# Altium schematic sheet zulu_a7_1.SchDoc
size 236 x 314 mm; Author: Christian Tambe; VERSION#: 1.0; Origin: Eagle; OriginPath: C:\Users\tambe\Documents\Electronics\Zulu_A7\Zulu_Altrium\zulu_a7.sch; OriginSheet: 2; OriginDescription: Power Supplies
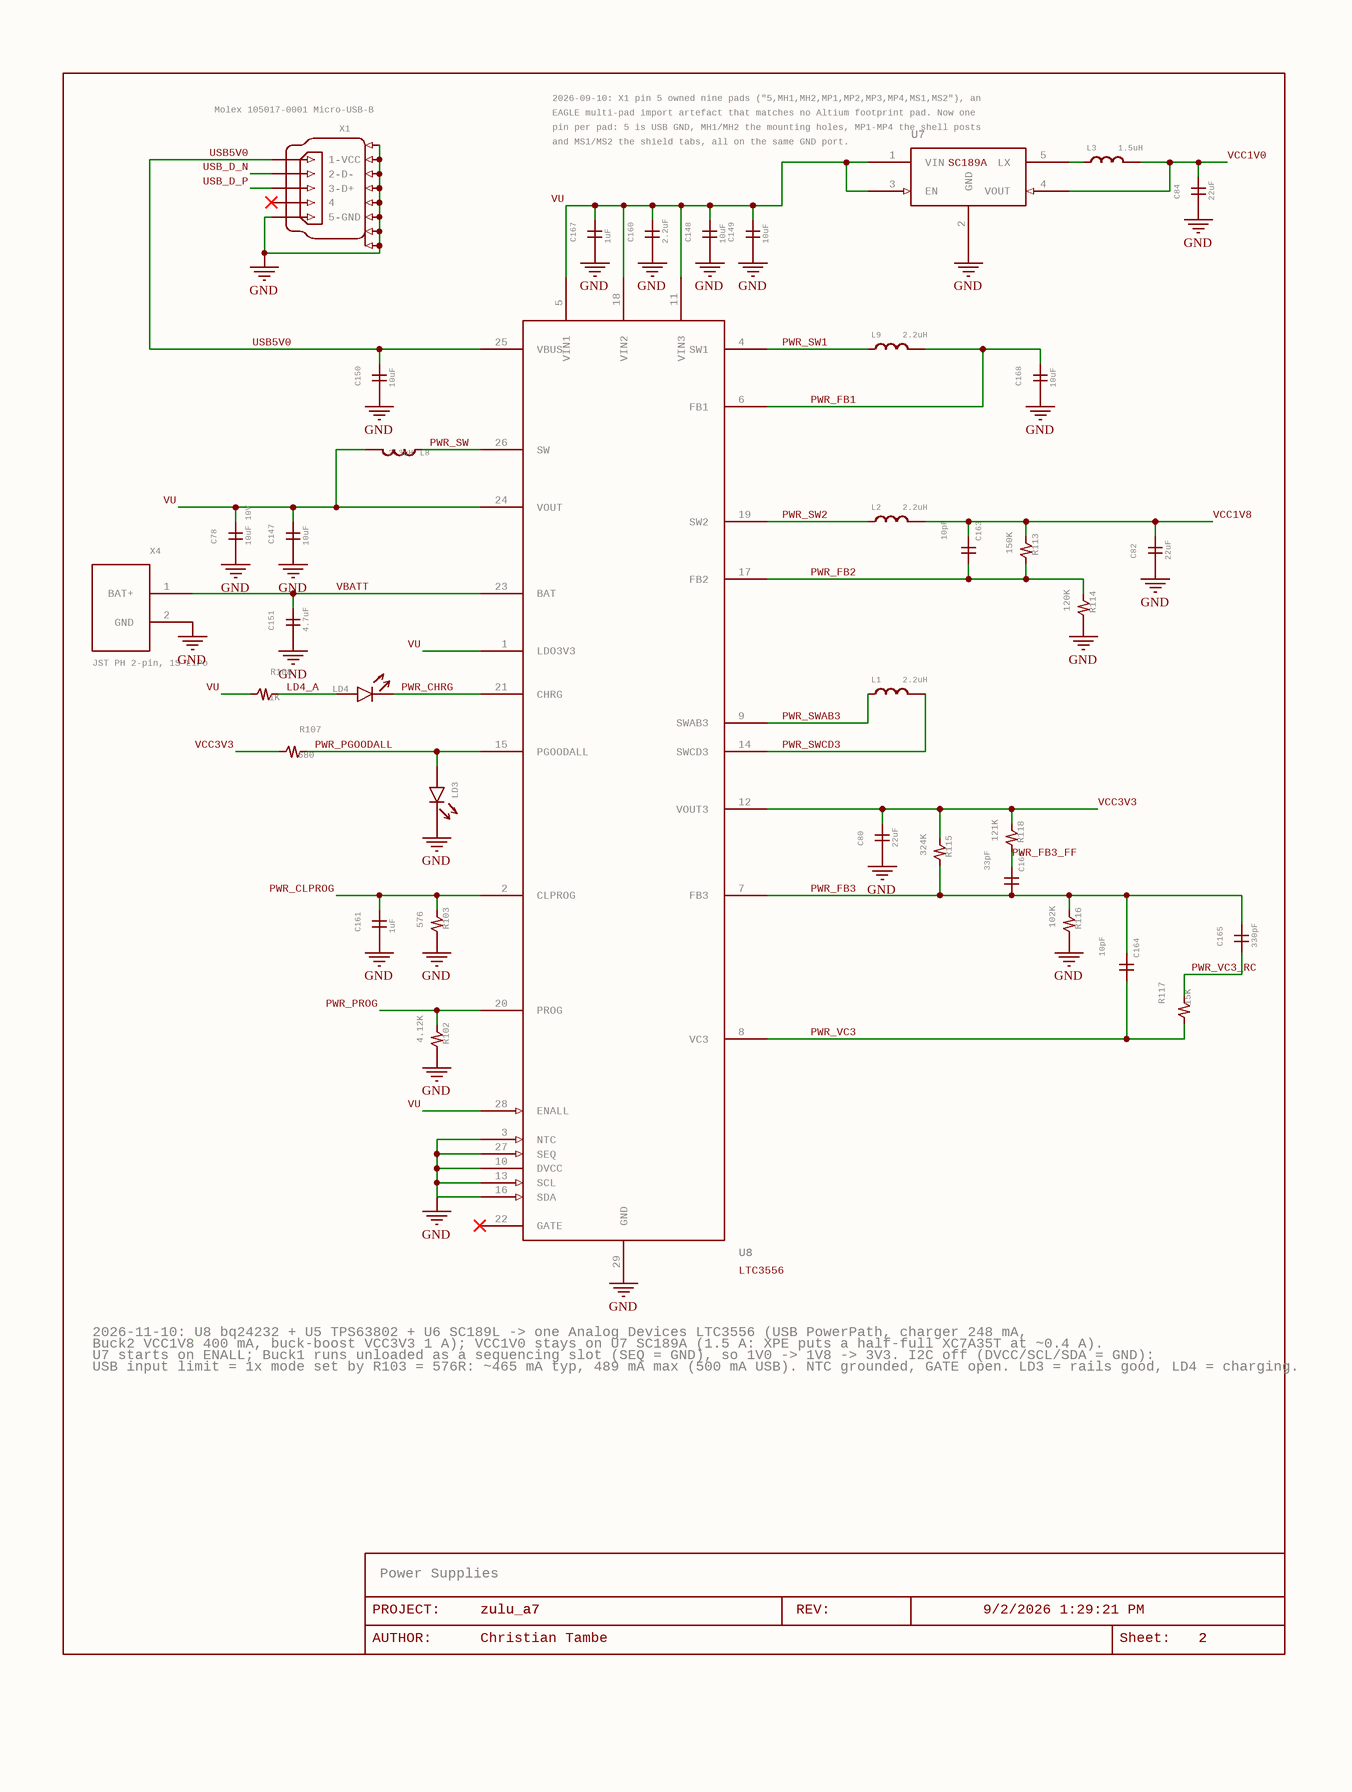
[diagram p0: zulu_a7_1.SchDoc]

## Parts
C78  10uF 10V  [C0805]
C80  22uF  [C0805]
C82  22uF  [C0603]
C84  22uF  [C0603]
C147  10uF  [C0603]
C148  10uF  [C0603]
C149  10uF  [C0805]
C150  10uF  [C0603]
C151  4.7uF  [C0603]
C160  2.2uF  [C0402]
C161  1uF  [C0402]
C163  10pF  [C0201]
C164  10pF  [C0201]
C165  330pF  [C0201]
C166  33pF  [C0201]
C167  1uF  [C0402]
C168  10uF  [C0603]
FRAME5  LAST_DATE_TIME: 9/2/2026 1:29:21 PM  Sheet: Sheet:  SHEET: 2  REV: REV:  PROJECT: PROJECT:  DRAWING_NAME: zulu_a7  AUTHOR: Christian Tambe  (hidden comment: DOCFIELD)  (graphical)
L1  2.2uH  [IND2520]
L2  2.2uH  [IND2520]
L3  1.5uH  [IND2520]
L8  3.3uH  [IND2520]
L9  2.2uH  [IND2520]
LD3  red  [LED0603]  (value not drawn)
LD4  red  [LED0603]  (value not drawn)
R102  4.12K  [R0402]
R103  576  [R0402]
R107  680  [R0402]
R108  1K  [R0402]
R113  150K  [R0201]
R114  120K  [R0201]
R115  324K  [R0201]
R116  102K  [R0201]
R117  15K  [R0201]
R118  121K  [R0201]
U7  PartName: SC189A  [SOT23-5]  (hidden comment: SC189ASKTRT)
U8  PartName: LTC3556  [QFN28-UFD-4X5]  (hidden comment: LTC3556EUFD#PBF)
X1  Molex 105017-0001 Micro-USB-B  [MOLEX-105017-0001]
X4  JST PH 2-pin, 1S LiPo  [JST-S2B-PH-SM4-TB]

## Nets
GND: C78.1 C80.1 C82.1 C84.1 C147.1 C148.1 C149.1 C150.1 C151.1 C160.1 C161.1 C167.1 C168.1 LD3.K R102.2 R103.2 R114.2 R116.2 U7.2(GND) U8.3(NTC) U8.10(DVCC) U8.13(SCL) U8.16(SDA) U8.27(SEQ) U8.29(GND) X1.5(5-GND) X1.MH1(GND) X1.MH2(GND) X1.MP1(GND) X1.MP2(GND) X1.MP3(GND) X1.MP4(GND) X1.MS1(GND) X1.MS2(GND) X4.2(GND)
LD4_A: LD4.A R108.2
PWR_CHRG: LD4.K U8.21(CHRG)
PWR_CLPROG: C161.2 R103.1 U8.2(CLPROG)
PWR_FB1: C168.2 L9.2 U8.6(FB1)
PWR_FB2: C163.2 R113.2 R114.1 U8.17(FB2)
PWR_FB3: C164.1 C165.2 C166.2 R115.2 R116.1 U8.7(FB3)
PWR_FB3_FF: C166.1 R118.2
PWR_PGOODALL: LD3.A R107.2 U8.15(PGOODALL)
PWR_PROG: R102.1 U8.20(PROG)
PWR_SW: L8.1 U8.26(SW)
PWR_SW1: L9.1 U8.4(SW1)
PWR_SW2: L2.1 U8.19(SW2)
PWR_SWAB3: L1.1 U8.9(SWAB3)
PWR_SWCD3: L1.2 U8.14(SWCD3)
PWR_VC3: C164.2 R117.1 U8.8(VC3)
PWR_VC3_RC: C165.1 R117.2
USB5V0: C150.2 U8.25(VBUS) X1.1(1-VCC)
USB_D_N: X1.2(2-D-)
USB_D_P: X1.3(3-D+)
VBATT: C151.2 U8.23(BAT) X4.1(BAT+)
VCC1V0: C84.2 L3.2 U7.4(VOUT)
VCC1V8: C82.2 C163.1 L2.2 R113.1
VCC3V3: C80.2 R107.1 R115.1 R118.1 U8.12(VOUT3)
VU: C78.2 C147.2 C148.2 C149.2 C160.2 C167.2 L8.2 R108.1 U7.1(VIN) U7.3(EN) U8.1(LDO3V3) U8.5(VIN1) U8.11(VIN3) U8.18(VIN2) U8.24(VOUT) U8.28(ENALL)
NetL3_1: L3.1 U7.5(LX)

Not connected (* = marked no-connect by the designer): U8 22(GATE)*; X1 4*

## Notes on the sheet
- 2026-09-10: X1 pin 5 owned nine pads ("5,MH1,MH2,MP1,MP2,MP3,MP4,MS1,MS2"), an
- (near U7) EAGLE multi-pad import artefact that matches no Altium footprint pad. Now one
- (near U7) pin per pad: 5 is USB GND, MH1/MH2 the mounting holes, MP1-MP4 the shell posts
- and MS1/MS2 the shield tabs, all on the same GND port.
- 2026-11-10: U8 bq24232 + U5 TPS63802 + U6 SC189L -> one Analog Devices LTC3556 (USB PowerPath, charger 248 mA,
- Buck2 VCC1V8 400 mA, buck-boost VCC3V3 1 A); VCC1V0 stays on U7 SC189A (1.5 A: XPE puts a half-full XC7A35T at ~0.4 A).
- U7 starts on ENALL; Buck1 runs unloaded as a sequencing slot (SEQ = GND), so 1V0 -> 1V8 -> 3V3. I2C off (DVCC/SCL/SDA = GND):
- USB input limit = 1x mode set by R103 = 576R: ~465 mA typ, 489 mA max (500 mA USB). NTC grounded, GATE open. LD3 = rails good, LD4 = charging.
- (near FRAME5) Power Supplies
- (near FRAME5) AUTHOR:

## Library data of the parts
C78 = C-GENERICC0603: CAPACITOR, generic non-polarized, horizontal pins; GateName_1: G$1; SymbolName_1: C-GENERIC-H; MANF: Samsung; MANF#: CL21A106KPFNNNG; SPEC: X5R 10V +-10% 0805 10uF -- VU bulk; DeviceName: C0805; LibraryName: rcl; DeviceSetName: C-GENERIC
C80 = C-GENERICC0603: CAPACITOR, generic non-polarized, horizontal pins; GateName_1: G$1; SymbolName_1: C-GENERIC-H; MANF: Murata; MANF#: GRM21BR61A226ME44L; SPEC: X5R 10V +-20% 0805 22uF -- buck-boost (VCC3V3) output capacitor, the 22 uF the Type III values assume; DeviceName: C0805; LibraryName: rcl; DeviceSetName: C-GENERIC
C82 = C-GENERICC0603: CAPACITOR, generic non-polarized, horizontal pins; GateName_1: G$1; SymbolName_1: C-GENERIC-H; MANF: Samsung; MANF#: CL10A226MP8NUNE; SPEC: X5R 10V +-20% 0603 22uF -- Buck2 (VCC1V8) output capacitor; DeviceName: C0603; LibraryName: rcl; DeviceSetName: C-GENERIC
C84 = C-GENERICC0603: CAPACITOR, generic non-polarized, horizontal pins; GateName_1: G$1; SymbolName_1: C-GENERIC-H; MANF: Samsung; MANF#: CL10A226MP8NUNE; SPEC: X5R 10V +-20% 0603 22uF -- U7 SC189A (VCC1V0) output capacitor; DeviceName: C0603; LibraryName: rcl; DeviceSetName: C-GENERIC
C147 = C-GENERICC0603: CAPACITOR, generic non-polarized, horizontal pins; GateName_1: G$1; SymbolName_1: C-GENERIC-H; MANF: Murata; MANF#: GRM188R61A106KE69D; SPEC: X5R 10V +-10% 0603 10uF -- LTC3556 VOUT (PowerPath output, pin 24) bypass; DeviceName: C0603; LibraryName: rcl; DeviceSetName: C-GENERIC
C148 = C-GENERICC0603: CAPACITOR, generic non-polarized, horizontal pins; GateName_1: G$1; SymbolName_1: C-GENERIC-H; MANF: Murata; MANF#: GRM188R61A106KE69D; SPEC: X5R 10V +-10% 0603 10uF -- LTC3556 VIN3 (buck-boost input, pin 11) bypass; DeviceName: C0603; LibraryName: rcl; DeviceSetName: C-GENERIC
C149 = C-GENERICC0805: CAPACITOR, generic non-polarized, horizontal pins; GateName_1: G$1; SymbolName_1: C-GENERIC-H; MANF: Samsung; MANF#: CL21A106KPFNNNG; SPEC: X5R 10V +-10% 0805 10uF -- U7 SC189A VIN bypass (>= 4.7 uF effective); DeviceName: C0805; LibraryName: rcl; DeviceSetName: C-GENERIC
C150 = C-GENERICC0603: CAPACITOR, generic non-polarized, horizontal pins; GateName_1: G$1; SymbolName_1: C-GENERIC-H; MANF: Murata; MANF#: GRM188R61C106MA73D; SPEC: X5R 16V +-20% 0603 10uF -- LTC3556 VBUS bypass (pin 25); DeviceName: C0603; LibraryName: rcl; DeviceSetName: C-GENERIC
C151 = C-GENERICC0603: CAPACITOR, generic non-polarized, horizontal pins; GateName_1: G$1; SymbolName_1: C-GENERIC-H; MANF: Murata; MANF#: GRM188R61C475KE11D; SPEC: X5R 16V +-10% 0603 4.7uF -- LTC3556 BAT bypass (pin 23), 1-22 uF ceramic; DeviceName: C0603; LibraryName: rcl; DeviceSetName: C-GENERIC
C160 = C-GENERICC0603: CAPACITOR, generic non-polarized, horizontal pins; GateName_1: G$1; SymbolName_1: C-GENERIC-H; MANF: Murata; MANF#: GRM155R61A225KE95D; SPEC: X5R 10V +-10% 0402 2.2uF -- LTC3556 VIN2 (Buck2 input, pin 18) bypass; DeviceName: C0402; LibraryName: rcl; DeviceSetName: C-GENERIC
C161 = C-GENERICC0603: CAPACITOR, generic non-polarized, horizontal pins; GateName_1: G$1; SymbolName_1: C-GENERIC-H; MANF: Murata; MANF#: GRM155R61A105KE15D; SPEC: X5R 10V +-10% 0402 1uF -- LTC3556 CLPROG averaging capacitor (>= 0.47 uF); DeviceName: C0402; LibraryName: rcl; DeviceSetName: C-GENERIC
C163 = C-GENERICC0603: CAPACITOR, generic non-polarized, horizontal pins; GateName_1: G$1; SymbolName_1: C-GENERIC-H; MANF: Murata; MANF#: GRM0335C1H100JA01D; SPEC: C0G 50V +-5% 0201 10pF -- Buck2 feed-forward across R113; DeviceName: C0201; LibraryName: rcl; DeviceSetName: C-GENERIC
C164 = C-GENERICC0603: CAPACITOR, generic non-polarized, horizontal pins; GateName_1: G$1; SymbolName_1: C-GENERIC-H; MANF: Murata; MANF#: GRM0335C1H100JA01D; SPEC: C0G 50V +-5% 0201 10pF -- Type III C1 (FB3 to VC3); DeviceName: C0201; LibraryName: rcl; DeviceSetName: C-GENERIC
C165 = C-GENERICC0603: CAPACITOR, generic non-polarized, horizontal pins; GateName_1: G$1; SymbolName_1: C-GENERIC-H; MANF: Murata; MANF#: GRM0335C1H331JA01D; SPEC: C0G 50V +-5% 0201 330pF -- Type III C2; DeviceName: C0201; LibraryName: rcl; DeviceSetName: C-GENERIC
C166 = C-GENERICC0603: CAPACITOR, generic non-polarized, horizontal pins; GateName_1: G$1; SymbolName_1: C-GENERIC-H; MANF: Murata; MANF#: GRM0335C1H330JA01D; SPEC: C0G 50V +-5% 0201 33pF -- Type III C3; DeviceName: C0201; LibraryName: rcl; DeviceSetName: C-GENERIC
C167 = C-GENERICC0603: CAPACITOR, generic non-polarized, horizontal pins; GateName_1: G$1; SymbolName_1: C-GENERIC-H; MANF: Murata; MANF#: GRM155R61A105KE15D; SPEC: X5R 10V +-10% 0402 1uF -- LTC3556 VIN1 (Buck1 input, pin 5) bypass, the 1 uF the datasheet asks for; DeviceName: C0402; LibraryName: rcl; DeviceSetName: C-GENERIC
C168 = C-GENERICC0603: CAPACITOR, generic non-polarized, horizontal pins; GateName_1: G$1; SymbolName_1: C-GENERIC-H; MANF: Murata; MANF#: GRM188R61A106KE69D; SPEC: X5R 10V +-10% 0603 10uF -- LTC3556 Buck1 output (sequencing slot, FB1 tied to it: 0.8 V, no load); DeviceName: C0603; LibraryName: rcl; DeviceSetName: C-GENERIC
FRAME5 = DOCFIELD: DOCUMENT FIELD; GateName_1: G$1; SymbolName_1: DOCFIELD; LibraryName: ctambe; DeviceSetName: DOCFIELD
L1 = INDUCTOR-2520: INDUCTOR, generic power inductor; GateName_1: G$1; MANF: Murata; MANF#: DFE252012F-2R2M=P2; SPEC: 2.2uH +-20%, Isat 3.3 A, Itemp 2.3 A, DCR 82 mOhm max, 2520 1.2 mm -- LTC3556 buck-boost (VCC3V3) inductor, SWAB3 to SWCD3; SymbolName_1: INDUCTOR; DeviceName: IND2520; LibraryName: ctambe; DeviceSetName: INDUCTOR
L2 = INDUCTOR-2520: INDUCTOR, generic power inductor; GateName_1: G$1; MANF: Murata; MANF#: DFE252012F-2R2M=P2; SPEC: 2.2uH +-20%, Isat 3.3 A, Itemp 2.3 A, DCR 82 mOhm max, 2520 1.2 mm -- LTC3556 Buck2 (VCC1V8) inductor (2520 like L1/L3: no verified Murata land pattern for the 2016 part); SymbolName_1: INDUCTOR; DeviceName: IND2520; LibraryName: ctambe; DeviceSetName: INDUCTOR
L3 = INDUCTOR-2520: INDUCTOR, generic power inductor; GateName_1: G$1; DeviceName: -2520; MANF: Murata; MANF#: DFE252010P-1R5M=P2; SPEC: 1.5uH +-20%, Isat >=1.8A, 1.00 mm max -- U7 SC189A LX inductor (VCC1V0), 2.5 MHz, <=0.31 A p-p ripple; SymbolName_1: INDUCTOR; LibraryName: ctambe; DeviceSetName: INDUCTOR
L8 = INDUCTOR-2520: INDUCTOR, generic power inductor; GateName_1: G$1; MANF: Murata; MANF#: DFE252012F-3R3M=P2; SPEC: 3.3uH +-20%, Isat 2.5 A, Itemp 1.8 A, DCR 135 mOhm max, 2520 1.2 mm -- LTC3556 PowerPath inductor (SW to VOUT); SymbolName_1: INDUCTOR; DeviceName: IND2520; LibraryName: ctambe; DeviceSetName: INDUCTOR
L9 = INDUCTOR-2520: INDUCTOR, generic power inductor; GateName_1: G$1; MANF: Murata; MANF#: DFE252012F-2R2M=P2; SPEC: 2.2uH +-20%, 2520 -- LTC3556 Buck1 kept running unloaded as the sequencing slot (SEQ = GND: Buck1 -> Buck2 -> buck-boost), so 1.8 V starts after U7 has brought up 1.0 V; SymbolName_1: INDUCTOR; DeviceName: IND2520; LibraryName: ctambe; DeviceSetName: INDUCTOR
LD3 = LED: GateName_1: G$1; MANF: Lite-On; MANF#: LTST-C191KRKT; NOTE: Power good: R107 680R from VCC3V3 lights LD3 once LTC3556 PGOODALL (pin 15, open drain) releases; PGOODALL holds it off until all three bucks are in regulation; SPEC: red -- LTC3556 PGOODALL: all three rails good (lights 230 ms after VCC3V3 is up); SymbolName_1: LED; LibraryName: ctambe; DeviceSetName: LED
LD4 = LED: GateName_1: G$1; MANF: Lite-On; MANF#: LTST-C191KRKT; NOTE: Charge status: LTC3556 CHRG (pin 21, open drain) sinks LD4 through R108 1.0k from VU while the battery charges; SPEC: red -- LTC3556 CHRG: on = charging, off = done / no USB, fast blink = bad battery; SymbolName_1: LED; LibraryName: ctambe; DeviceSetName: LED
R102 = R-US_SMALLR0402: RESISTOR, American symbol, small 2-zigzag variant (sheet 2 only); GateName_1: G$1; MANF: Yageo; MANF#: RC0402FR-074K12L; SPEC: thick film +-1% 0402 -- LTC3556 PROG: 1022 V / 4.12k = 248 mA charge current; SymbolName_1: R-US_SMALL; DeviceName: R0402; LibraryName: rcl; DeviceSetName: R-US_SMALL
R103 = R-US_SMALLR0402: RESISTOR, American symbol, small 2-zigzag variant (sheet 2 only); GateName_1: G$1; MANF: Yageo; MANF#: RC0402FR-07576RL; SPEC: thick film +-1% 0402 -- LTC3556 CLPROG, 500 mA USB limit with I2C off (1x mode, hCLPROG 224): 1.188 V x 225 / 576 = 464 mA + 0.4 mA typ, ~425-489 mA over the datasheet spread; CLPROG pin 2.1 mA < 3 mA abs max; SymbolName_1: R-US_SMALL; DeviceName: R0402; LibraryName: rcl; DeviceSetName: R-US_SMALL
R107 = R-US_SMALLR0402: RESISTOR, American symbol, small 2-zigzag variant (sheet 2 only); GateName_1: G$1; MANF: Yageo; MANF#: RC0402FR-07680RL; SPEC: thick film +-1% 0402 -- PGOODALL pull-up and LD3 current: (3.3 - 2.0) / 680 = 1.9 mA; SymbolName_1: R-US_SMALL; DeviceName: R0402; LibraryName: rcl; DeviceSetName: R-US_SMALL
R108 = R-US_SMALLR0402: RESISTOR, American symbol, small 2-zigzag variant (sheet 2 only); GateName_1: G$1; MANF: Yageo; MANF#: RC0402FR-071KL; SPEC: thick film +-1% 0402 -- LD4 (CHRG) current: (3.7 - 2.0) / 1.0k = 1.7 mA; SymbolName_1: R-US_SMALL; DeviceName: R0402; LibraryName: rcl; DeviceSetName: R-US_SMALL
R113 = R-US_SMALLR0402: RESISTOR, American symbol, small 2-zigzag variant (sheet 2 only); GateName_1: G$1; MANF: Yageo; MANF#: RC0201FR-07150KL; SPEC: thick film +-1% 0201 -- Buck2 divider top: 0.8 V x (1 + 150k/120k) = 1.800 V; SymbolName_1: R-US_SMALL; DeviceName: R0201; LibraryName: rcl; DeviceSetName: R-US_SMALL
R114 = R-US_SMALLR0402: RESISTOR, American symbol, small 2-zigzag variant (sheet 2 only); GateName_1: G$1; MANF: Yageo; MANF#: RC0201FR-07120KL; SPEC: thick film +-1% 0201 -- Buck2 divider bottom; SymbolName_1: R-US_SMALL; DeviceName: R0201; LibraryName: rcl; DeviceSetName: R-US_SMALL
R115 = R-US_SMALLR0402: RESISTOR, American symbol, small 2-zigzag variant (sheet 2 only); GateName_1: G$1; MANF: Yageo; MANF#: RC0201FR-07324KL; SPEC: thick film +-1% 0201 -- buck-boost divider top / Type III R1 (sets the compensation; keep): 0.8 V x (1 + 324k/104k) = 3.29 V; SymbolName_1: R-US_SMALL; DeviceName: R0201; LibraryName: rcl; DeviceSetName: R-US_SMALL
R116 = R-US_SMALLR0402: RESISTOR, American symbol, small 2-zigzag variant (sheet 2 only); GateName_1: G$1; MANF: Yageo; MANF#: RC0201FR-07102KL; SPEC: thick film +-1% 0201 -- buck-boost divider bottom (RFB, DC only): VCC3V3 = 0.8 V x (1 + 324k/102k) = 3.34 V (2026-11-11: 104k 0.1% ERA-1AEB1043C does not exist; ERA-1AEB 0201 stops at 10k); SymbolName_1: R-US_SMALL; DeviceName: R0201; LibraryName: rcl; DeviceSetName: R-US_SMALL
R117 = R-US_SMALLR0402: RESISTOR, American symbol, small 2-zigzag variant (sheet 2 only); GateName_1: G$1; MANF: Yageo; MANF#: RC0201FR-0715KL; SPEC: thick film +-1% 0201 -- Type III R2 (with C165, VC3 to FB3); SymbolName_1: R-US_SMALL; DeviceName: R0201; LibraryName: rcl; DeviceSetName: R-US_SMALL
R118 = R-US_SMALLR0402: RESISTOR, American symbol, small 2-zigzag variant (sheet 2 only); GateName_1: G$1; MANF: Yageo; MANF#: RC0201FR-07121KL; SPEC: thick film +-1% 0201 -- Type III R3 (with C166 across R115); SymbolName_1: R-US_SMALL; DeviceName: R0201; LibraryName: rcl; DeviceSetName: R-US_SMALL
U7 = SC189-SOT23-5: 1.5A 2.5MHz synchronous buck, fixed output (Semtech SC189); MANF: Semtech; MANF#: SC189ASKTRT
U8 = LTC3556-UFD28: USB power manager: PowerPath + Li-ion charger + dual 400 mA buck + 1 A buck-boost (Analog Devices LTC3556, UFD QFN-28 4 x 5 mm); MANF: Analog Devices; MANF#: LTC3556EUFD#PBF
X1 = MINI-USB-105017-0001: MINI USB Connector   Source: http://www.hirose.co.jp/cataloge_hp/e24000019.pdf; GateName_1: G$1; SymbolName_1: MINI-USB; DeviceName: 105017-0001; LibraryName: ctambe; DeviceSetName: MINI-USB-; MANF: Molex; MANF#: 105017-0001
X4 = JST-S2B-PH-SM4-TB: JST PH 2.0 mm 2-pin side-entry SMT header, LiPo battery input; GateName_1: G$1; SymbolName_1: CONN-2; DeviceName: S2B-SM4-TB; DeviceSetName: JST-PH-2; MANF#: S2B-PH-SM4-TB(LF)(SN); SPEC: JST PH 2.0 mm, 2 circuits, side-entry SMT header, 2 A, 100 V, -25..85 C, mates with PHR-2; pin 1 = battery +, pin 2 = GND; NOTE: S2B-PH-SM4-TB(LF)(SN), top-side SMT side-entry header between X2 pins 30 and 31; the opening faces the south board edge, so the cable plugs in parallel to the board. There is no universal JST-PH LiPo polarity standard: verify pack positive goes to pin 1 before plugging in.; LibraryName: ctambe; MANF: JST